# Altium schematic sheet 05_test4.SchDoc
size A3
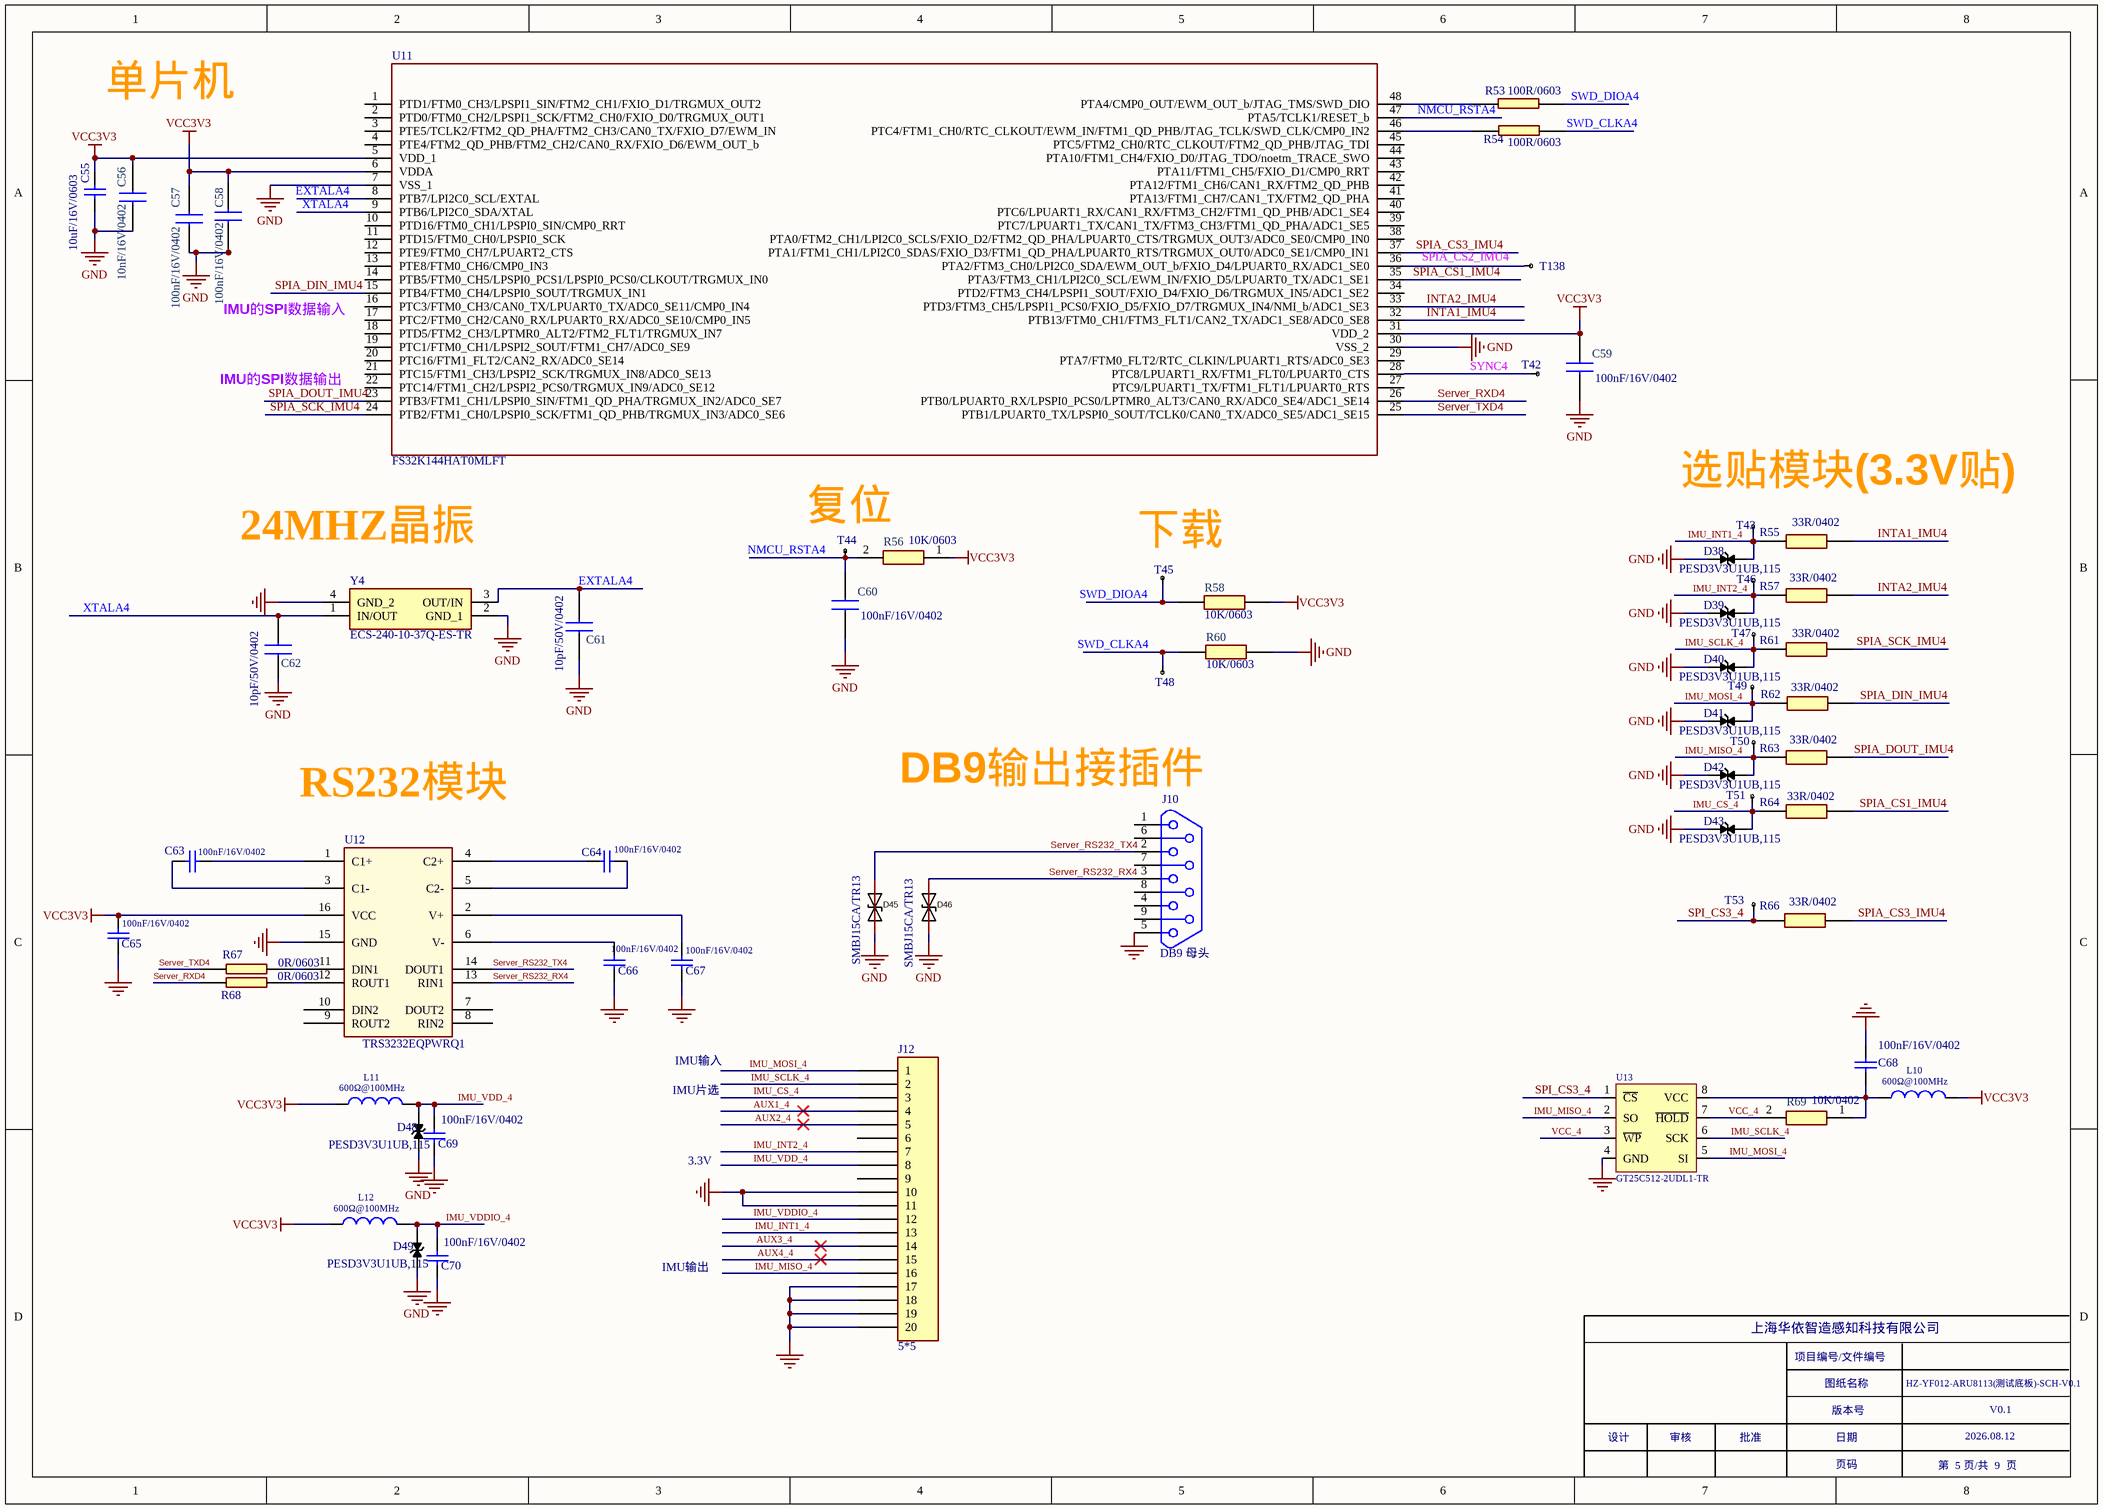
[diagram p0: 05_test4.SchDoc]

## Parts
C55  10uF/16V/0603  [C 0603_L]
C56  10nF/16V/0402  [C 0402_L]
C57  100nF/16V/0402  [C 0402_L]
C58  100nF/16V/0402  [C 0402_L]
C59  100nF/16V/0402  [C 0402_L]
C60  100nF/16V/0402  [C 0402_L]
C61  10pF/50V/0402  [C 0402_L]
C62  10pF/50V/0402  [C 0402_L]
C63  value 100nF/16V/0402  [C 0402_L]  (hidden comment: Cap)
C64  value 100nF/16V/0402  [C 0402_L]  (hidden comment: Cap)
C65  value 100nF/16V/0402  [C 0402_L]  (hidden comment: Cap)
C66  value 100nF/16V/0402  [C 0402_L]  (hidden comment: Cap)
C67  value 100nF/16V/0402  [C 0402_L]  (hidden comment: Cap)
C68  100nF/16V/0402  [C 0402_L]
C69  100nF/16V/0402  [C 0402_L]
C70  100nF/16V/0402  [0402C]
D38  PESD3V3U1UB,115  [SOD-523]
D39  PESD3V3U1UB,115  [SOD-523]
D40  PESD3V3U1UB,115  [SOD-523]
D41  PESD3V3U1UB,115  [SOD-523]
D42  PESD3V3U1UB,115  [SOD-523]
D43  PESD3V3U1UB,115  [SOD-523]
D45  SMBJ15CA/TR13  [SMB]
D46  SMBJ15CA/TR13  [SMB]
D48  PESD3V3U1UB,115  [PESD3V3U1UB,115]
D49  PESD3V3U1UB,115  [SOD-523]
J10  DB9 母头  [DB9-RS8R1-2R77]
J12  5*5  [5*5-socket]
L10  value 600Ω@100MHz  [0603L]  (hidden comment: Inductor)
L11  value 600Ω@100MHz  [0603L]  (hidden comment: Inductor)
L12  value 600Ω@100MHz  [0603L]  (hidden comment: Inductor)
R53  100R/0603  [R 0603_L]
R54  100R/0603  [R 0603_L]
R55  33R/0402  [0402R]
R56  10K/0603  [R 0603_L]
R57  33R/0402  [0402R]
R58  10K/0603  [R 0603_L]
R60  10K/0603  [0603R]
R61  33R/0402  [0402R]
R62  33R/0402  [0402R]
R63  33R/0402  [0402R]
R64  33R/0402  [0402R]
R66  33R/0402  [0402R]
R67  0R/0603  [R 0603_L]
R68  0R/0603  [R 0603_L]
R69  10K/0402  [0402R]
T42  TEST  [Test-0.5mm]  (value not drawn)
T43  TEST  [TEST]  (value not drawn)
T44  TEST  [TEST]  (value not drawn)
T45  TEST  [TEST]  (value not drawn)
T46  TEST  [TEST]  (value not drawn)
T47  TEST  [TEST]  (value not drawn)
T48  TEST  [TEST]  (value not drawn)
T49  TEST  [TEST]  (value not drawn)
T50  TEST  [TEST]  (value not drawn)
T51  TEST  [TEST]  (value not drawn)
T53  TEST  [TEST]  (value not drawn)
T138  TEST  [Test-0.5mm]  (value not drawn)
U11  FS32K144HAT0MLFT  [LQFP48_7X7]
U12  TRS3232EQPWRQ1  [TSSOP16_640X500]
U13  GT25C512-2UDL1-TR  [GT25C512-2UDLA2-TR]
Y4  ECS-240-10-37Q-ES-TR  [ECS2401037QESTR]

## Nets
GND: C55.2 C56.1 C57.2 C58.2 C59.2 C60.2 C61.1 C62.1 C65.2 C66.2 C67.2 C68.1 C69.2 C70.2 D38.1 D39.1 D40.1 D41.1 D42.1 D43.1 D45.1 D46.1 D48.1 D49.1 J10.5 J12.10 J12.11 J12.17 J12.18 J12.19 J12.20 R60.1 U11.7(VSS_1) U11.30(VSS_2) U12.15(GND) U13.4(GND) Y4.2(GND_1) Y4.4(GND_2)
VCC3V3: C55.1 C56.2 C57.1 C58.1 C59.1 C65.1 L10.2 L11.1 L12.1 R56.1 R58.1 U11.5(VDD_1) U11.6(VDDA) U11.31(VDD_2) U12.16(VCC)
AUX1_4: J12.4
AUX2_4: J12.5
AUX3_4: J12.14
AUX4_4: J12.15
EXTALA4: C61.2 U11.8(PTB7/LPI2C0_SCL/EXTAL) Y4.3(OUT/IN)
IMU_CS_4: D43.2 J12.3 R64.2 T51.1
IMU_INT1_4: D38.2 J12.13 R55.2 T43.1
IMU_INT2_4: D39.2 J12.7 R57.2 T46.1
IMU_MISO_4: D42.2 J12.16 R63.2 T50.1 U13.2(SO)
IMU_MOSI_4: D41.2 J12.1 R62.2 T49.1 U13.5(SI)
IMU_SCLK_4: D40.2 J12.2 R61.2 T47.1 U13.6(SCK)
IMU_VDD_4: C69.1 D48.2 J12.8 L11.2
IMU_VDDIO_4: C70.1 D49.2 J12.12 L12.2
INTA1_IMU4: R55.1 U11.32(PTB13/FTM0_CH1/FTM3_FLT1/CAN2_TX/ADC1_SE8/ADC0_SE8)
INTA2_IMU4: R57.1 U11.33(PTD3/FTM3_CH5/LPSPI1_PCS0/FXIO_D5/FXIO_D7/TRGMUX_IN4/NMI_b/ADC1_SE3)
NMCU_RSTA4: C60.1 R56.2 T44.1 U11.47(PTA5/TCLK1/RESET_b)
Server_RS232_RX4: D46.2 J10.3 U12.13(RIN1)
Server_RS232_TX4: D45.2 J10.2 U12.14(DOUT1)
Server_RXD4: R68.1 U11.26(PTB0/LPUART0_RX/LPSPI0_PCS0/LPTMR0_ALT3/CAN0_RX/ADC0_SE4/ADC1_SE14)
Server_TXD4: R67.1 U11.25(PTB1/LPUART0_TX/LPSPI0_SOUT/TCLK0/CAN0_TX/ADC0_SE5/ADC1_SE15)
SPI_CS3_4: R66.2 T53.1 U13.1(~{CS})
SPIA_CS1_IMU4: R64.1 U11.35(PTA3/FTM3_CH1/LPI2C0_SCL/EWM_IN/FXIO_D5/LPUART0_TX/ADC1_SE1)
SPIA_CS3_IMU4: R66.1 U11.37(PTA1/FTM1_CH1/LPI2C0_SDAS/FXIO_D3/FTM1_QD_PHA/LPUART0_RTS/TRGMUX_OUT0/ADC0_SE1/CMP0_IN1)
SPIA_DIN_IMU4: R62.1 U11.15(PTB4/FTM0_CH4/LPSPI0_SOUT/TRGMUX_IN1)
SPIA_DOUT_IMU4: R63.1 U11.23(PTB3/FTM1_CH1/LPSPI0_SIN/FTM1_QD_PHA/TRGMUX_IN2/ADC0_SE7)
SPIA_SCK_IMU4: R61.1 U11.24(PTB2/FTM1_CH0/LPSPI0_SCK/FTM1_QD_PHB/TRGMUX_IN3/ADC0_SE6)
SWD_CLKA4: R54.2 R60.2 T48.1
SWD_DIOA4: R53.2 R58.2 T45.1
SYNC4: T42.1 U11.28(PTC8/LPUART1_RX/FTM1_FLT0/LPUART0_CTS)
VCC_4: R69.2 U13.3(~{WP}) U13.7(~{HOLD})
XTALA4: C62.2 U11.9(PTB6/LPI2C0_SDA/XTAL) Y4.1(IN/OUT)
NetC63_1: C63.1 U12.3(C1-)
NetC63_2: C63.2 U12.1(C1+)
NetC64_1: C64.1 U12.4(C2+)
NetC64_2: C64.2 U12.5(C2-)
NetC66_1: C66.1 U12.6(V-)
NetC67_1: C67.1 U12.2(V+)
NetC68_2: C68.2 L10.1 R69.1 U13.8(VCC)
NetR53_1: R53.1 U11.48(PTA4/CMP0_OUT/EWM_OUT_b/JTAG_TMS/SWD_DIO)
NetR54_1: R54.1 U11.46(PTC4/FTM1_CH0/RTC_CLKOUT/EWM_IN/FTM1_QD_PHB/JTAG_TCLK/SWD_CLK/CMP0_IN2)
NetR67_2: R67.2 U12.11(DIN1)
NetR68_2: R68.2 U12.12(ROUT1)
NetT138_1: T138.1 U11.36(PTA2/FTM3_CH0/LPI2C0_SDA/EWM_OUT_b/FXIO_D4/LPUART0_RX/ADC1_SE0)

Not connected (* = marked no-connect by the designer): J10 1 4 6 7 8 9; J12 6 9; U11 1(PTD1/FTM0_CH3/LPSPI1_SIN/FTM2_CH1/FXIO_D1/TRGMUX_OUT2) 2(PTD0/FTM0_CH2/LPSPI1_SCK/FTM2_CH0/FXIO_D0/TRGMUX_OUT1) 3(PTE5/TCLK2/FTM2_QD_PHA/FTM2_CH3/CAN0_TX/FXIO_D7/EWM_IN) 4(PTE4/FTM2_QD_PHB/FTM2_CH2/CAN0_RX/FXIO_D6/EWM_OUT_b) 10(PTD16/FTM0_CH1/LPSPI0_SIN/CMP0_RRT) 11(PTD15/FTM0_CH0/LPSPI0_SCK) 12(PTE9/FTM0_CH7/LPUART2_CTS) 13(PTE8/FTM0_CH6/CMP0_IN3) 14(PTB5/FTM0_CH5/LPSPI0_PCS1/LPSPI0_PCS0/CLKOUT/TRGMUX_IN0) 16(PTC3/FTM0_CH3/CAN0_TX/LPUART0_TX/ADC0_SE11/CMP0_IN4) 17(PTC2/FTM0_CH2/CAN0_RX/LPUART0_RX/ADC0_SE10/CMP0_IN5) 18(PTD5/FTM2_CH3/LPTMR0_ALT2/FTM2_FLT1/TRGMUX_IN7) 19(PTC1/FTM0_CH1/LPSPI2_SOUT/FTM1_CH7/ADC0_SE9) 20(PTC16/FTM1_FLT2/CAN2_RX/ADC0_SE14) 21(PTC15/FTM1_CH3/LPSPI2_SCK/TRGMUX_IN8/ADC0_SE13) 22(PTC14/FTM1_CH2/LPSPI2_PCS0/TRGMUX_IN9/ADC0_SE12) 27(PTC9/LPUART1_TX/FTM1_FLT1/LPUART0_RTS) 29(PTA7/FTM0_FLT2/RTC_CLKIN/LPUART1_RTS/ADC0_SE3) 34(PTD2/FTM3_CH4/LPSPI1_SOUT/FXIO_D4/FXIO_D6/TRGMUX_IN5/ADC1_SE2) 38(PTA0/FTM2_CH1/LPI2C0_SCLS/FXIO_D2/FTM2_QD_PHA/LPUART0_CTS/TRGMUX_OUT3/ADC0_SE0/CMP0_IN0) 39(PTC7/LPUART1_TX/CAN1_TX/FTM3_CH3/FTM1_QD_PHA/ADC1_SE5) 40(PTC6/LPUART1_RX/CAN1_RX/FTM3_CH2/FTM1_QD_PHB/ADC1_SE4) 41(PTA13/FTM1_CH7/CAN1_TX/FTM2_QD_PHA) 42(PTA12/FTM1_CH6/CAN1_RX/FTM2_QD_PHB) 43(PTA11/FTM1_CH5/FXIO_D1/CMP0_RRT) 44(PTA10/FTM1_CH4/FXIO_D0/JTAG_TDO/noetm_TRACE_SWO) 45(PTC5/FTM2_CH0/RTC_CLKOUT/FTM2_QD_PHB/JTAG_TDI); U12 7(DOUT2) 8(RIN2) 9(ROUT2) 10(DIN2)

## Notes on the sheet
- 单片机
- IMU的SPI数据输入
- IMU的SPI数据输出
- 选贴模块(3.3V贴)
- (near Y4) 24MHZ晶振
- (near T44) 复位
- (near T45) 下载
- DB9输出接插件
- (near U12) RS232模块
- IMU片选
- IMU输入
- 3.3V
- IMU输出
- 上海华依智造感知科技有限公司
- 项目编号/文件编号
- 图纸名称
- HZ-YF012-ARU8113(测试底板)-SCH-V0.1
- 设计
- 审核
- 批准
- 版本号
- 日期
- 2026.08.12
- V0.1
- 页码
- 第  5 页/共  9  页
- Labels drawn without touching a wire or pin: SPIA_CS2_IMU4

## Library data of the parts
C55 = Cap: SMD/SMT 10UF 16V 20% 0603; Published: 8-Jun-2000; LatestRevisionDate: 17-Jul-2002; LatestRevisionNote: Re-released for DXP Platform.; PackageReference: RAD-0.3; Publisher: Altium Limited; PackageDescription: Radial Cap, Thru-Hole; 2 Leads; 0.3 in Pin Spacing; Value: 10uF/16V
C56-C62 = 0402Capacitor: Capacitor; Manufacturer_Name: Murata Electronics; Manufacturer_Part_Number: GCM155R71C104KA55D; Datasheet Link: https://componentsearchengine.com//GCM155R71C104KA55D.pdf; Height: 0.55mm; Mouser2 Part Number: 81-GCM155R71C104KA5D; Mouser2 Price/Stock: https://www.mouser.com/Search/Refine.aspx?Keyword=81-GCM155R71C104KA5D
C63-C70 = Cap: '100nF/16V/10%/ 0402/X7R / -55℃ ～ 125℃/AEC-Q200; Published: 8-Jun-2000; LatestRevisionDate: 17-Jul-2002; LatestRevisionNote: Re-released for DXP Platform.; PackageReference: RAD-0.3; Publisher: Altium Limited; PackageDescription: Radial Cap, Thru-Hole; 2 Leads; 0.3 in Pin Spacing
  C68-C70: Value: 100nF/16V/0402
D38-D43 D48 D49 = SMBJ36CA: 双向TVS管；600W表面贴装瞬态电压抑制器,工作电压36V，SMB_DO-214AA封装 DIODES
D45 D46 = SMBJ15CA/TR13_C78410: Manufacturer: Brightking(君耀电子); Symbol: SMBJ15CA-C78410; Add into BOM: yes; polarity: 双向; Reverse Stand-Off Voltage (Vrwm): 15V; Maximum Clamping Voltage: 24.4V; Peak Pulse Current (Ipp)@10/1000us: 24.6A; Peak Pulse Power Dissipation (Ppp)@10/1000us: 600W; Breakdown Voltage: 16.7V; Type: TVS; Device: SMBJ15CA/TR13_C78410; LCSC Part Name: 双向 15V截止 24.6A峰值脉冲; Supplier Part: C78410; Manufacturer Part: SMBJ15CA/TR13; Supplier Footprint: SMB(DO-214AA); JLCPCB Part Class: Extended Part; Datasheet: https://atta.szlcsc.com/upload/public/pdf/source/20181127/C309995_EB3DFB9F9AEE5D2146ECD9FA5992A402.pdf; Supplier: LCSC; Convert to PCB: yes
J10 = DB9
L10-L12 = Inductor: Code_IEC: 1005; Published: 8-Jun-2000; LatestRevisionDate: 29-May-2009; LatestRevisionNote: IPC-7351 Footprint Added.; PackageReference: 0402-A; Publisher: Altium Limited; PackageDescription: Chip Inductor; Code_JEITA: 0402
R53 R54 R67 R68 = 0402
R55-R58 R60-R64 R66 R69 = 0402Resistor: Resistor; Manufacturer_Name: KOA Speer; Manufacturer_Part_Number: RN73H1ETTP1002F50; Datasheet Link: https://www.mouser.fr/datasheet/2/219/RN73H-12200.pdf; Height: 0.4mm
U11 = FS32K144HAT0MLFT: Integrated Circuit; Manufacturer_Name: NXP; Datasheet Link: http://www.nxp.com/docs/en/data-sheet/S32K-DS.pdf; Height: 1.6mm; Manufacturer_Part_Number: FS32K144HAT0MLFT
U13 = GT25C512-2UDLA2-TR
Y4 = ECS-240-10-37Q-ES-TR: Crystal or Oscillator; Manufacturer_Name: ECS; Datasheet Link: https://www.ecsxtal.com/store/pdf/ECX-1637Q.pdf; Height: 0.55mm; Manufacturer_Part_Number: ECS-240-10-37Q-ES-TR